# Altium schematic sheet Sheet_1.schdoc
size 288 x 204 mm; SheetNumber: 1; SheetTotal: 2
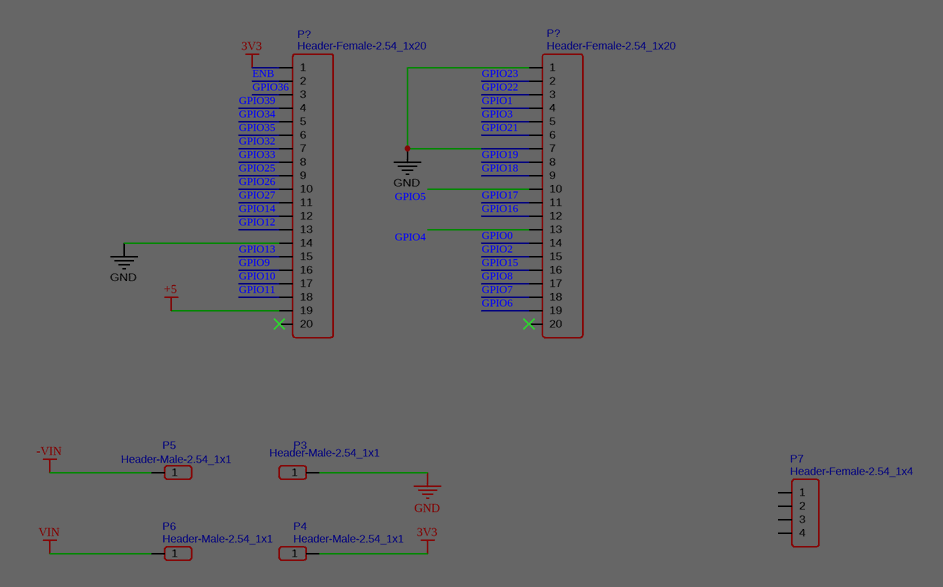
[diagram p0: Sheet_1.schdoc]

## Parts
(Parts that share a designator on the sheet are numbered #1, #2 ... from top to bottom, then left to right.)
P3  Header-Male-2.54_1x1  [HDR-TH_1P-P2.54-V-M]
P4  Header-Male-2.54_1x1  [HDR-TH_1P-P2.54-V-M]
P5  Header-Male-2.54_1x1  [HDR-TH_1P-P2.54-V-M]
P6  Header-Male-2.54_1x1  [HDR-TH_1P-P2.54-V-M]
P7  Header-Female-2.54_1x4  [HDR-4X1/2.54]
P?#1  Header-Female-2.54_1x20  [AMPHENOL_76341-322LF]
P?#2  Header-Female-2.54_1x20  [HDR-TH_20P-P2.54-V-F]

## Nets
3V3: P4.1 P?#1.1
+5: P?#1.19
-VIN: P5.1
GND: P3.1 P?#1.14 P?#2.1 P?#2.7
VIN: P6.1
ENB: P?#1.2
GPIO0: P?#2.14
GPIO1: P?#2.4
GPIO2: P?#2.15
GPIO3: P?#2.5
GPIO4: P?#2.13
GPIO5: P?#2.10
GPIO6: P?#2.19
GPIO7: P?#2.18
GPIO8: P?#2.17
GPIO9: P?#1.16
GPIO10: P?#1.17
GPIO11: P?#1.18
GPIO12: P?#1.13
GPIO13: P?#1.15
GPIO14: P?#1.12
GPIO15: P?#2.16
GPIO16: P?#2.12
GPIO17: P?#2.11
GPIO18: P?#2.9
GPIO19: P?#2.8
GPIO21: P?#2.6
GPIO22: P?#2.3
GPIO23: P?#2.2
GPIO25: P?#1.9
GPIO26: P?#1.10
GPIO27: P?#1.11
GPIO32: P?#1.7
GPIO33: P?#1.8
GPIO34: P?#1.5
GPIO35: P?#1.6
GPIO36: P?#1.3
GPIO39: P?#1.4

Not connected (* = marked no-connect by the designer): P7 1 2 3 4; P?#1 20*; P?#2 20*

## Library data of the parts
P3-P6 = Header-Male-2.54_1x1: Manufacturer: BOOMELE(博穆精密); Manufacturer Part: 2.54-1*1P针; Supplier: LCSC; Supplier Part: C81276; JLCPCB Part Class: Extended Part; spicePre: P; spiceSymbolName: Header-Male-2.54_1x1
P7 = Header-Female-2.54_1x4: Manufacturer: ReliaPro; Supplier: LCSC; Manufacturer Part: Header-Female-2.54_1x4; Supplier Part: C124413; spicePre: P; spiceSymbolName: Header-Female-2.54_1x4
P?#1 P?#2 = Header-Female-2.54_1x20: Manufacturer: BOOMELE(博穆精密); Manufacturer Part: 2.54-1*20P母; Supplier: LCSC; Supplier Part: C50984; JLCPCB Part Class: Extended Part; spicePre: P; spiceSymbolName: Header-Female-2.54_1x20